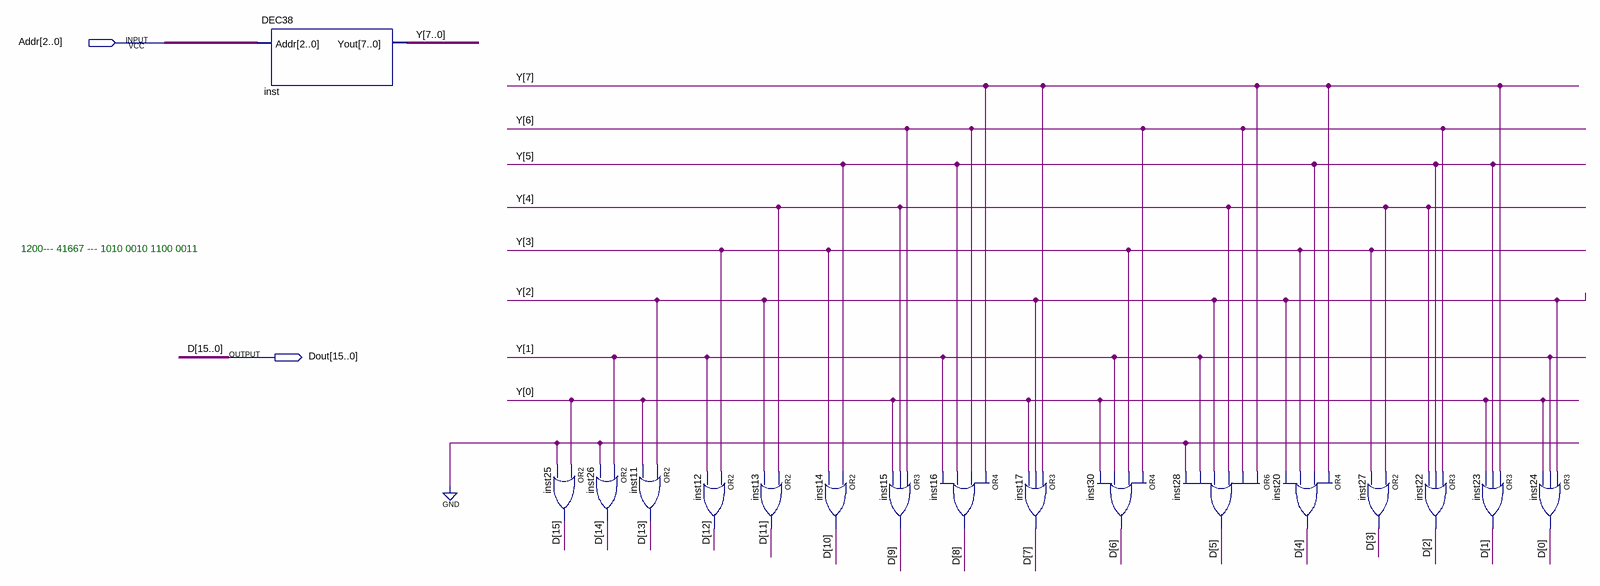
[diagram p0: schematic sheet]
// Quartus schematic memory.bdf as structural Verilog: 17 symbols, 2 pins
module memory (
  input  [2:0] Addr,
  output [15:0] Dout
);

  wire [7:0] Y;

  DEC38 inst (.Addr(Addr), .Yout(Y));
  or inst25 (Dout[15], Y[0], 1'b0);
  or inst26 (Dout[14], Y[1], 1'b0);
  or inst11 (Dout[13], Y[2], Y[0]);
  or inst12 (Dout[12], Y[3], Y[1]);
  or inst13 (Dout[11], Y[4], Y[2]);
  or inst14 (Dout[10], Y[5], Y[3]);
  or inst15 (Dout[9], Y[6], Y[4], Y[0]);
  or inst16 (Dout[8], Y[7], Y[6], Y[5], Y[1]);
  or inst17 (Dout[7], Y[7], Y[2], Y[0]);
  or inst30 (Dout[6], Y[6], Y[3], Y[1], Y[0]);
  or inst28 (Dout[5], Y[7], Y[6], Y[4], Y[2], Y[1], 1'b0);
  or inst20 (Dout[4], Y[7], Y[5], Y[3], Y[2]);
  or inst27 (Dout[3], Y[4], Y[3]);
  or inst22 (Dout[2], Y[6], Y[5], Y[4]);
  or inst23 (Dout[1], Y[7], Y[5], Y[0]);
  or inst24 (Dout[0], Y[2], Y[1], Y[0]);

  // Other names for the same wires on the sheet: D[15:0] = Dout

  // Notes on the sheet:
  //   1200--- 41667 --- 1010 0010 1100 0011
endmodule
